# Altium schematic sheet Controller_Section.SchDoc
size A4; DocumentNumber: 2; SheetNumber: 2; SheetTotal: 4
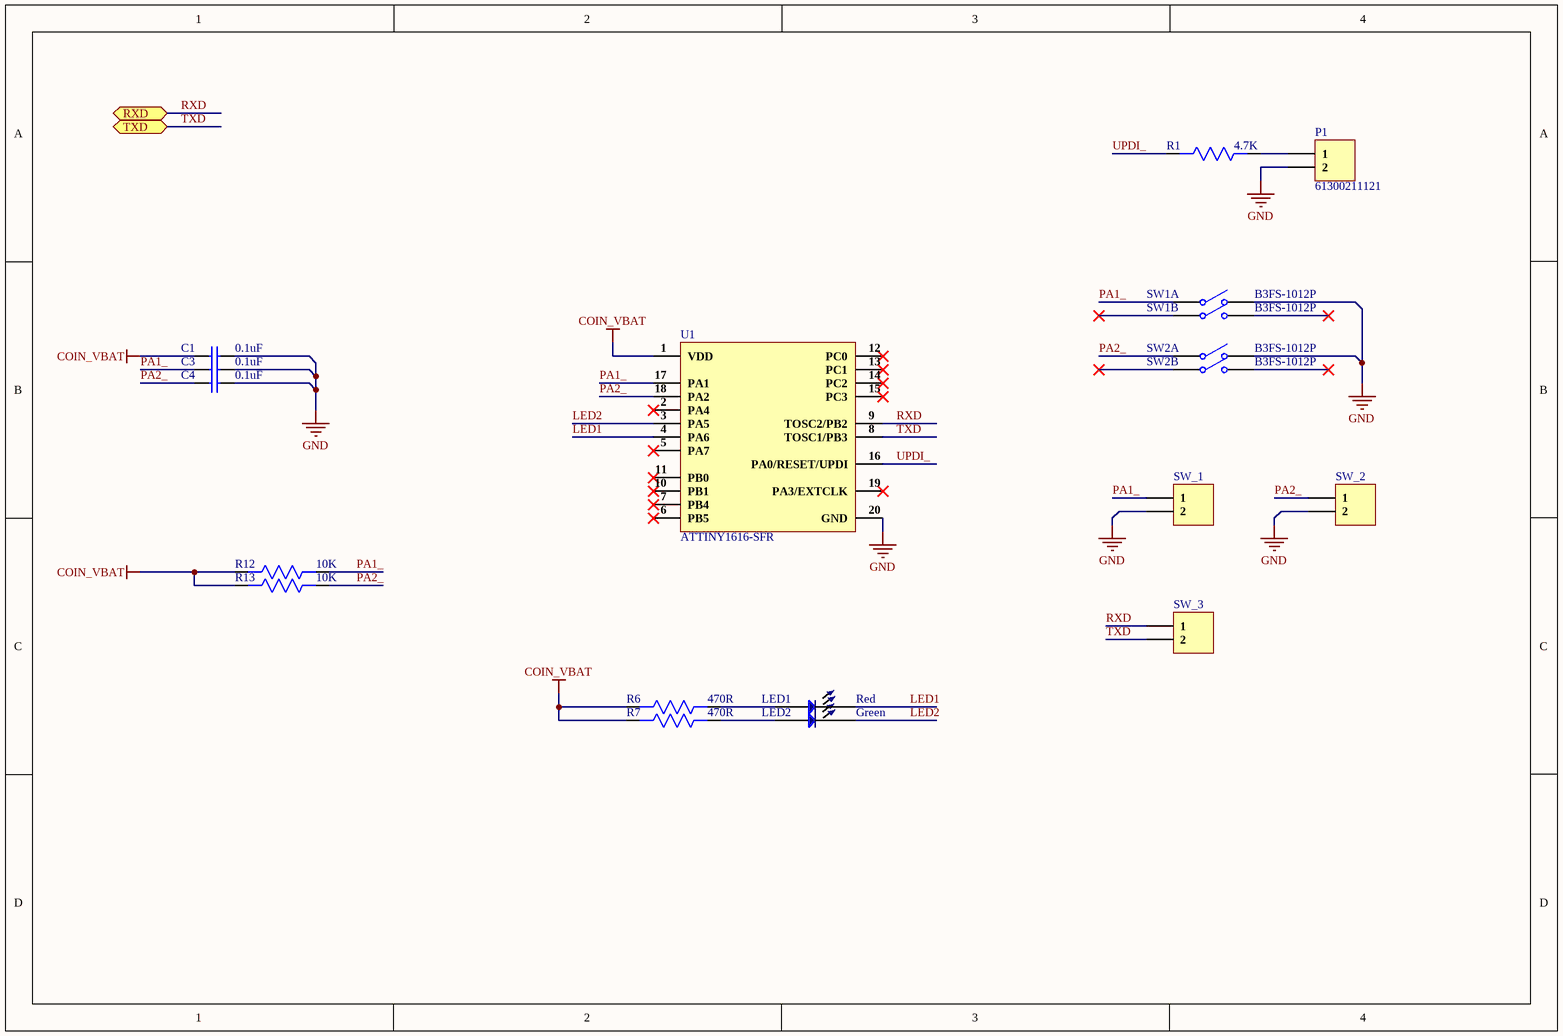
[diagram p0: Controller_Section.SchDoc]

## Parts
C1  0.1uF  [Cap0402]
C3  0.1uF  [Cap0402]
C4  0.1uF  [Cap0402]
LED1  Color: Red  [LTL-10223W]  (hidden comment: LTL-10223W)
LED2  Color: Green  [LTL-4231N]  (hidden comment: LTL-4231N)
P1  61300211121  [HDR1X2]
R1  4.7K  [Res0402]
R6  470R  [Res0402]
R7  470R  [Res0402]
R12  10K  [Res0402]
R13  10K  [Res0402]
SW1  B3FS-1012P  [B3FS-1012P]  (parts A,B of 2)
SW2  B3FS-1012P  [B3FS-1012P]  (parts A,B of 2)
SW_1  61300211121  [HDR1X2]  (value not drawn)
SW_2  61300211121  [HDR1X2]  (value not drawn)
SW_3  61300211121  [HDR1X2]  (value not drawn)
U1  ATTINY1616-SFR  [ATTINY1616-SFR]

## Ports
RXD (bidir), TXD (bidir)

## Nets
COIN_VBAT: C1.1 R6.2 R7.2 R12.2 R13.2 U1.1(VDD)
GND: C1.2 C3.2 C4.2 P1.2 SW1.3 SW2.3 SW_1.2 SW_2.2 U1.20(GND)
LED1: LED1.1 U1.4(PA6)
LED2: LED2.1 U1.3(PA5)
PA1_: C3.1 R12.1 SW1.1 SW_1.1 U1.17(PA1)
PA2_: C4.1 R13.1 SW2.1 SW_2.1 U1.18(PA2)
RXD: SW_3.1 U1.9(TOSC2/PB2) ; port RXD
TXD: SW_3.2 U1.8(TOSC1/PB3) ; port TXD
UPDI_: R1.2 U1.16(PA0/RESET/UPDI)
NetLED1_2: LED1.2 R6.1
NetLED2_2: LED2.2 R7.1
NetP1_1: P1.1 R1.1

Not connected (* = marked no-connect by the designer): SW1 2* 4*; SW2 2* 4*; U1 2(PA4)* 5(PA7)* 6(PB5)* 7(PB4)* 10(PB1)* 11(PB0)* 12(PC0)* 13(PC1)* 14(PC2)* 15(PC3)* 19(PA3/EXTCLK)*

## Library data of the parts
C1 C3 C4 = CC0402KRX7R7BB104: CAP CER 0.1UF 16V X7R 0402; Manufacturer: Yageo; Tolerance: 10%; Capacitance: 100nF; Supplier 1: Digi-Key; Manufacturer Part Number: CC0402KRX7R7BB104; Stock 1: 16982736; Pricing 1: 1=0.1, 10=0.034, 100=0.015, 500=0.0107, 1000=0.00841, 2500=0.00764, 5000=0.00703 (USD); Mount: Surface Mount; Case/Package: 0402; Number of Pins: 2; Case Code (Metric): 1005; Case Code (Imperial): 0402; Min Operating Temperature: -55°C; Max Operating Temperature: 125°C; Dielectric: X7R; Voltage Rating: 16V; Voltage Rating (DC): 16V; Packaging: Tape and Reel; Package Quantity: 1; Termination: SMD/SMT; Composition: Ceramic; Voltage: 16V; Length: 1mm; Height: 0.5mm; Width: 0.02inch; Thickness: 0.022inch; Depth: 0.5mm; Radiation Hardening: No; REACH SVHC: No SVHC; Lead Free: Lead Free; Halogen Free: Halogen Free; ComponentLink1URL: http://www.yageo.com/documents/recent/UPY-GPHC_X7R_6.3V-to-50V_8.pdf?src-supplier=Avnet+Europe; ComponentLink1Description: http://www.yageo.com/documents/recent/UPY-GPHC_X7R_6.3V-to-50V_8.pdf?src-supplier=Avnet+Europe; ComponentLink2URL: http://www.yageo.com/documents/recent/UPY-GPHC_X7R_6.3V-to-50V_18.pdf?src-supplier=Digi-Key; ComponentLink2Description: http://www.yageo.com/documents/recent/UPY-GPHC_X7R_6.3V-to-50V_18.pdf?src-supplier=Digi-Key; ComponentLink3URL: http://www.yageo.com/documents/recent/UPY-GPHC_X7R_6.3V-to-50V_8.pdf?src-supplier=Avnet; ComponentLink3Description: http://www.yageo.com/documents/recent/UPY-GPHC_X7R_6.3V-to-50V_8.pdf?src-supplier=Avnet; ComponentLink4URL: http://www.yageo.com/documents/recent/UPY-GPHC_X7R_6.3V-to-50V_18.pdf?src-supplier=Mouser; ComponentLink4Description: http://www.yageo.com/documents/recent/UPY-GPHC_X7R_6.3V-to-50V_18.pdf?src-supplier=Mouser; ComponentLink5URL: http://www.farnell.com/datasheets/2167236.pdf?src-supplier=Element14; ComponentLink5Description: http://www.farnell.com/datasheets/2167236.pdf?src-supplier=Element14; ComponentLink6URL: http://www.farnell.com/datasheets/1489800.pdf?src-supplier=Element14; ComponentLink6Description: http://www.farnell.com/datasheets/1489800.pdf?src-supplier=Element14; Supplier Part Number 1: 311-1338-1-ND
LED1 = LTL-10223W: LED RED DIFFUSED T/H; Manufacturer: Vishay Lite-On; Luminous Intensity: 60mcd; Lens Style: Dome,Diffused,Colored,Circular,Tinted; Wavelength: 623nm; Viewing Angle: 60°; Forward Voltage: 2V; Test Current: 10mA; Number of LEDs: 1; Forward Current: 30mA; Max Power Dissipation: 100mW; Reverse Voltage: 5V; Supplier 1: Digi-Key; Manufacturer Part Number: LTL-10223W; Stock 1: 31450; Pricing 1: 1=0.36, 10=0.262, 100=0.1242, 500=0.0828, 1000=0.06486, 2500=0.06348, 5000=0.0552, 10000=0.04968, 25000=0.04416 (USD); Mount: Through Hole; Case/Package: Radial; Number of Pins: 2; Lens Color: Red; Min Operating Temperature: -55°C; Max Operating Temperature: 100°C; Package Quantity: 1000; Packaging: Bulk; Illumination Color: Red; Lens Transparency: Diffused; Dominant Wavelength: 623nm; Number of Elements: 1; Power Dissipation: 100mW; Diameter: 4.75mm; Length: 4.75mm; Height: 7.2mm; Width: 4.75mm; Depth: 4.75mm; Radiation Hardening: No; Lead Free: Lead Free; ComponentLink1URL: http://www.mouser.com/ds/2/239/_100_10223W-53344.pdf?src-supplier=Mouser; ComponentLink1Description: http://www.mouser.com/ds/2/239/_100_10223W-53344.pdf?src-supplier=Mouser; ComponentLink2URL: https://media.digikey.com/pdf/Data%20Sheets/Lite-On%20PDFs/LTL-10223W.pdf?src-supplier=Digi-Key; ComponentLink2Description: https://media.digikey.com/pdf/Data%20Sheets/Lite-On%20PDFs/LTL-10223W.pdf?src-supplier=Digi-Key; ComponentLink3URL: https://www.verical.com/server-webapp/html/getDatasheet?partID=141762&src-supplier=Verical; ComponentLink3Description: https://www.verical.com/server-webapp/html/getDatasheet?partID=141762&src-supplier=Verical; ComponentLink4URL: http://www1.futureelectronics.com/doc/LITE-ON/LTL-10223W.pdf?src-supplier=Future+Electronics; ComponentLink4Description: http://www1.futureelectronics.com/doc/LITE-ON/LTL-10223W.pdf?src-supplier=Future+Electronics; Supplier Part Number 1: 160-1087-ND
LED2 = LTL-4231N: LED GREEN DIFFUSED T/H; Manufacturer: Vishay Lite-On; Lens Style: Diffused,Tinted,Dome,Colored,Circular; Viewing Angle: 60°; Luminous Intensity: 12.6mcd; Dominant Wavelength: 569nm; Forward Current: 30mA; Forward Voltage: 2.1V; Wavelength: 572nm; Test Current: 10mA; Number of Elements: 1; Power Dissipation: 120mW; Reverse Voltage: 5V; Max Power Dissipation: 100mW; Supplier 1: Digi-Key; Manufacturer Part Number: LTL-4231N; Stock 1: 21640; Pricing 1: 1=0.36, 10=0.262, 100=0.1242, 500=0.0828, 1000=0.06486, 2500=0.06348, 5000=0.0552, 10000=0.04968, 25000=0.04416 (USD); Mount: Through Hole; Case/Package: T; Number of Pins: 2; Min Operating Temperature: -55°C; Max Operating Temperature: 100°C; Packaging: Bulk; Package Quantity: 1000; Number of LEDs: 1; Illumination Color: Green; Diameter: 3mm; Length: 4.45mm; Height: 4.45mm; Depth: 4.45mm; Width: 4.45mm; Radiation Hardening: No; Lead Free: Lead Free; ComponentLink1URL: http://www1.futureelectronics.com/doc/LITE%20ON/LITE-ON%20LTL-4231N.pdf?src-supplier=Future+Electronics; ComponentLink1Description: http://www1.futureelectronics.com/doc/LITE%20ON/LITE-ON%20LTL-4231N.pdf?src-supplier=Future+Electronics; ComponentLink2URL: https://www.verical.com/server-webapp/html/getDatasheet?partID=115099&src-supplier=Verical; ComponentLink2Description: https://www.verical.com/server-webapp/html/getDatasheet?partID=115099&src-supplier=Verical; ComponentLink3URL: http://www.onlinecomponents.com/productFiles/mf-LI/791p_100_ltl-4231n.pdf?src-supplier=Onlinecomponents.com; ComponentLink3Description: http://www.onlinecomponents.com/productFiles/mf-LI/791p_100_ltl-4231n.pdf?src-supplier=Onlinecomponents.com; ComponentLink4URL: http://www.jameco.com/Jameco/Products/ProdDS/697637.pdf?src-supplier=Jameco; ComponentLink4Description: http://www.jameco.com/Jameco/Products/ProdDS/697637.pdf?src-supplier=Jameco; Supplier Part Number 1: 160-1142-ND
P1 SW_1-SW_3 = Header 1x2: CONN HEADER VERT 2POS 2.54MM; Manufacturer: Wurth Electronics; Current Rating: 3A; Voltage Rating: 250V; Number of Positions: 2; Gender: Male; Connector Type: Male Pin; Pitch: 0.1inch; Supplier 1: Digi-Key; Manufacturer Part Number: 61300211121; Stock 1: 219205; Pricing 1: 1=0.13, 10=0.106, 25=0.088, 50=0.074, 100=0.067, 1000=0.061 (USD); Mount: Through Hole; Contact Plating: Gold; Housing Material: PBT; Contact Material: Copper Alloy,Copper; Color: Black; Min Operating Temperature: -40°C; Max Operating Temperature: 125°C; Number of Rows: 1; Contact Gender: Male; Packaging: Bulk; Termination: Through Hole; Number of Contacts: 2; Contact Mating Length: 0.236inch; REACH SVHC: Unknown; Lead Free: Lead Free; ComponentLink1URL: http://www.mouser.com/ds/2/445/6130xx11121-538006.pdf?src-supplier=Mouser; ComponentLink1Description: http://www.mouser.com/ds/2/445/6130xx11121-538006.pdf?src-supplier=Mouser; Supplier Part Number 1: 732-5315-ND
R1 = CR0402JF0472G: 4.7K ±5% 1/16W ±200ppm/°C 0402 Chip Resistor - Surface Mount RoHS; Manufacturer: LIZ Elec; Manufacturer Part No: CR0402JF0472G; Package: 0402; Value: 4.7K
R6 R7 = RTT02471JTH: 470 ±5% 1/16W ±100ppm/°C 0402 Chip Resistor - Surface Mount RoHS; Manufacturer: RALEC; Manufacturer Part No: RTT02471JTH; Package: 0402; Value: 470R
R12 R13 = RK73B1ETTP103J: RES 10K OHM 5% 1/10W 0402; Manufacturer: KOA Speer; Resistance: 10kR; Power Rating: 63mW; Voltage Rating: 50V; Temperature Coefficient: 200ppm/°C; Supplier 1: Digi-Key; Manufacturer Part Number: RK73B1ETTP103J; Stock 1: 2917894; Pricing 1: 1=0.1, 10=0.016, 100=0.0065, 1000=0.00292, 2500=0.00253, 5000=0.00209 (USD); Mount: Surface Mount; Case/Package: 0402; Case Code (Imperial): 0402; Case Code (Metric): 1005; Min Operating Temperature: -55°C; Max Operating Temperature: 155°C; Packaging: Tape and Reel; Tolerance: 5%; Package Quantity: 10000; Composition: Thick Film; Termination: SMD/SMT; Military Standard: Not; Voltage Rating (DC): 50V; Length: 1mm; Height: 0.35mm; Width: 0.5mm; Depth: 0.5mm; Lead Free: Lead Free; ComponentLink1URL: https://www.verical.com/server-webapp/html/getDatasheet?partID=89073&src-supplier=Verical; ComponentLink1Description: https://www.verical.com/server-webapp/html/getDatasheet?partID=89073&src-supplier=Verical; Supplier Part Number 1: 2019-RK73B1ETTP103JCT-ND
SW1 SW2 = B3FS-1012P: SWITCH TACTILE SPST-NO 0.05A 24V; Manufacturer: Omron; Mechanical Life: 300000Cycles; Throw Configuration: SPST; Contact Resistance: 100mR; Operating Force: 1.47N; Current Rating: 50mA; Illumination Type: Non-Illuminated; Switch Travel: 0.25mm; Switch Function: Off-Mom; Actuator Type: Standard; Actuator Length: 1.7mm; Supplier 1: Digi-Key; Manufacturer Part Number: B3FS-1012P; Stock 1: 177804; Pricing 1: 1=0.59, 10=0.569, 25=0.548, 100=0.4741, 250=0.43192, 500=0.40034 (USD); Mount: Surface Mount; Case/Package: SMD/SMT; Weight: 0.2g; Contact Plating: Silver; Min Operating Temperature: -20°C; Max Operating Temperature: 70°C; Voltage Rating (DC): 24V; Packaging: Tape and Reel; Max Voltage Rating (DC): 24V; Package Quantity: 1; Max Current Rating: 50mA; Termination: Gull Wing; Electrical Life: 300000Cycles; Orientation: Straight; Length: 6.3mm; Depth: 8mm; Radiation Hardening: No; ComponentLink1URL: https://omronfs.omron.com/en_US/ecb/products/pdf/en-b3fs.pdf?src-supplier=Digi-Key; ComponentLink1Description: https://omronfs.omron.com/en_US/ecb/products/pdf/en-b3fs.pdf?src-supplier=Digi-Key; ComponentLink2URL: http://omronfs.omron.com/en_US/ecb/products/pdf/en-b3fs.pdf?src-supplier=Digi-Key; ComponentLink2Description: http://omronfs.omron.com/en_US/ecb/products/pdf/en-b3fs.pdf?src-supplier=Digi-Key; Supplier Part Number 1: SW1237CT-ND
U1 = ATTINY1616-SFR: IC MCU 8BIT 16KB FLASH 20SOIC; Manufacturer: Microchip; Supplier 1: Digi-Key; Manufacturer Part Number: ATTINY1616-SFR; Stock 1: 1061; Pricing 1: 1=0.92, 25=0.85, 100=0.77 (USD); ComponentLink1URL: https://4donline.ihs.com/images/VipMasterIC/IC/MCHP/MCHP-S-A0008147170/MCHP-S-A0008495385-1.pdf?src-supplier=Farnell; ComponentLink1Description: https://4donline.ihs.com/images/VipMasterIC/IC/MCHP/MCHP-S-A0008147170/MCHP-S-A0008495385-1.pdf?src-supplier=Farnell; Supplier Part Number 1: ATTINY1616-SFRCT-ND